# Altium project ika_kart.PrjPcb
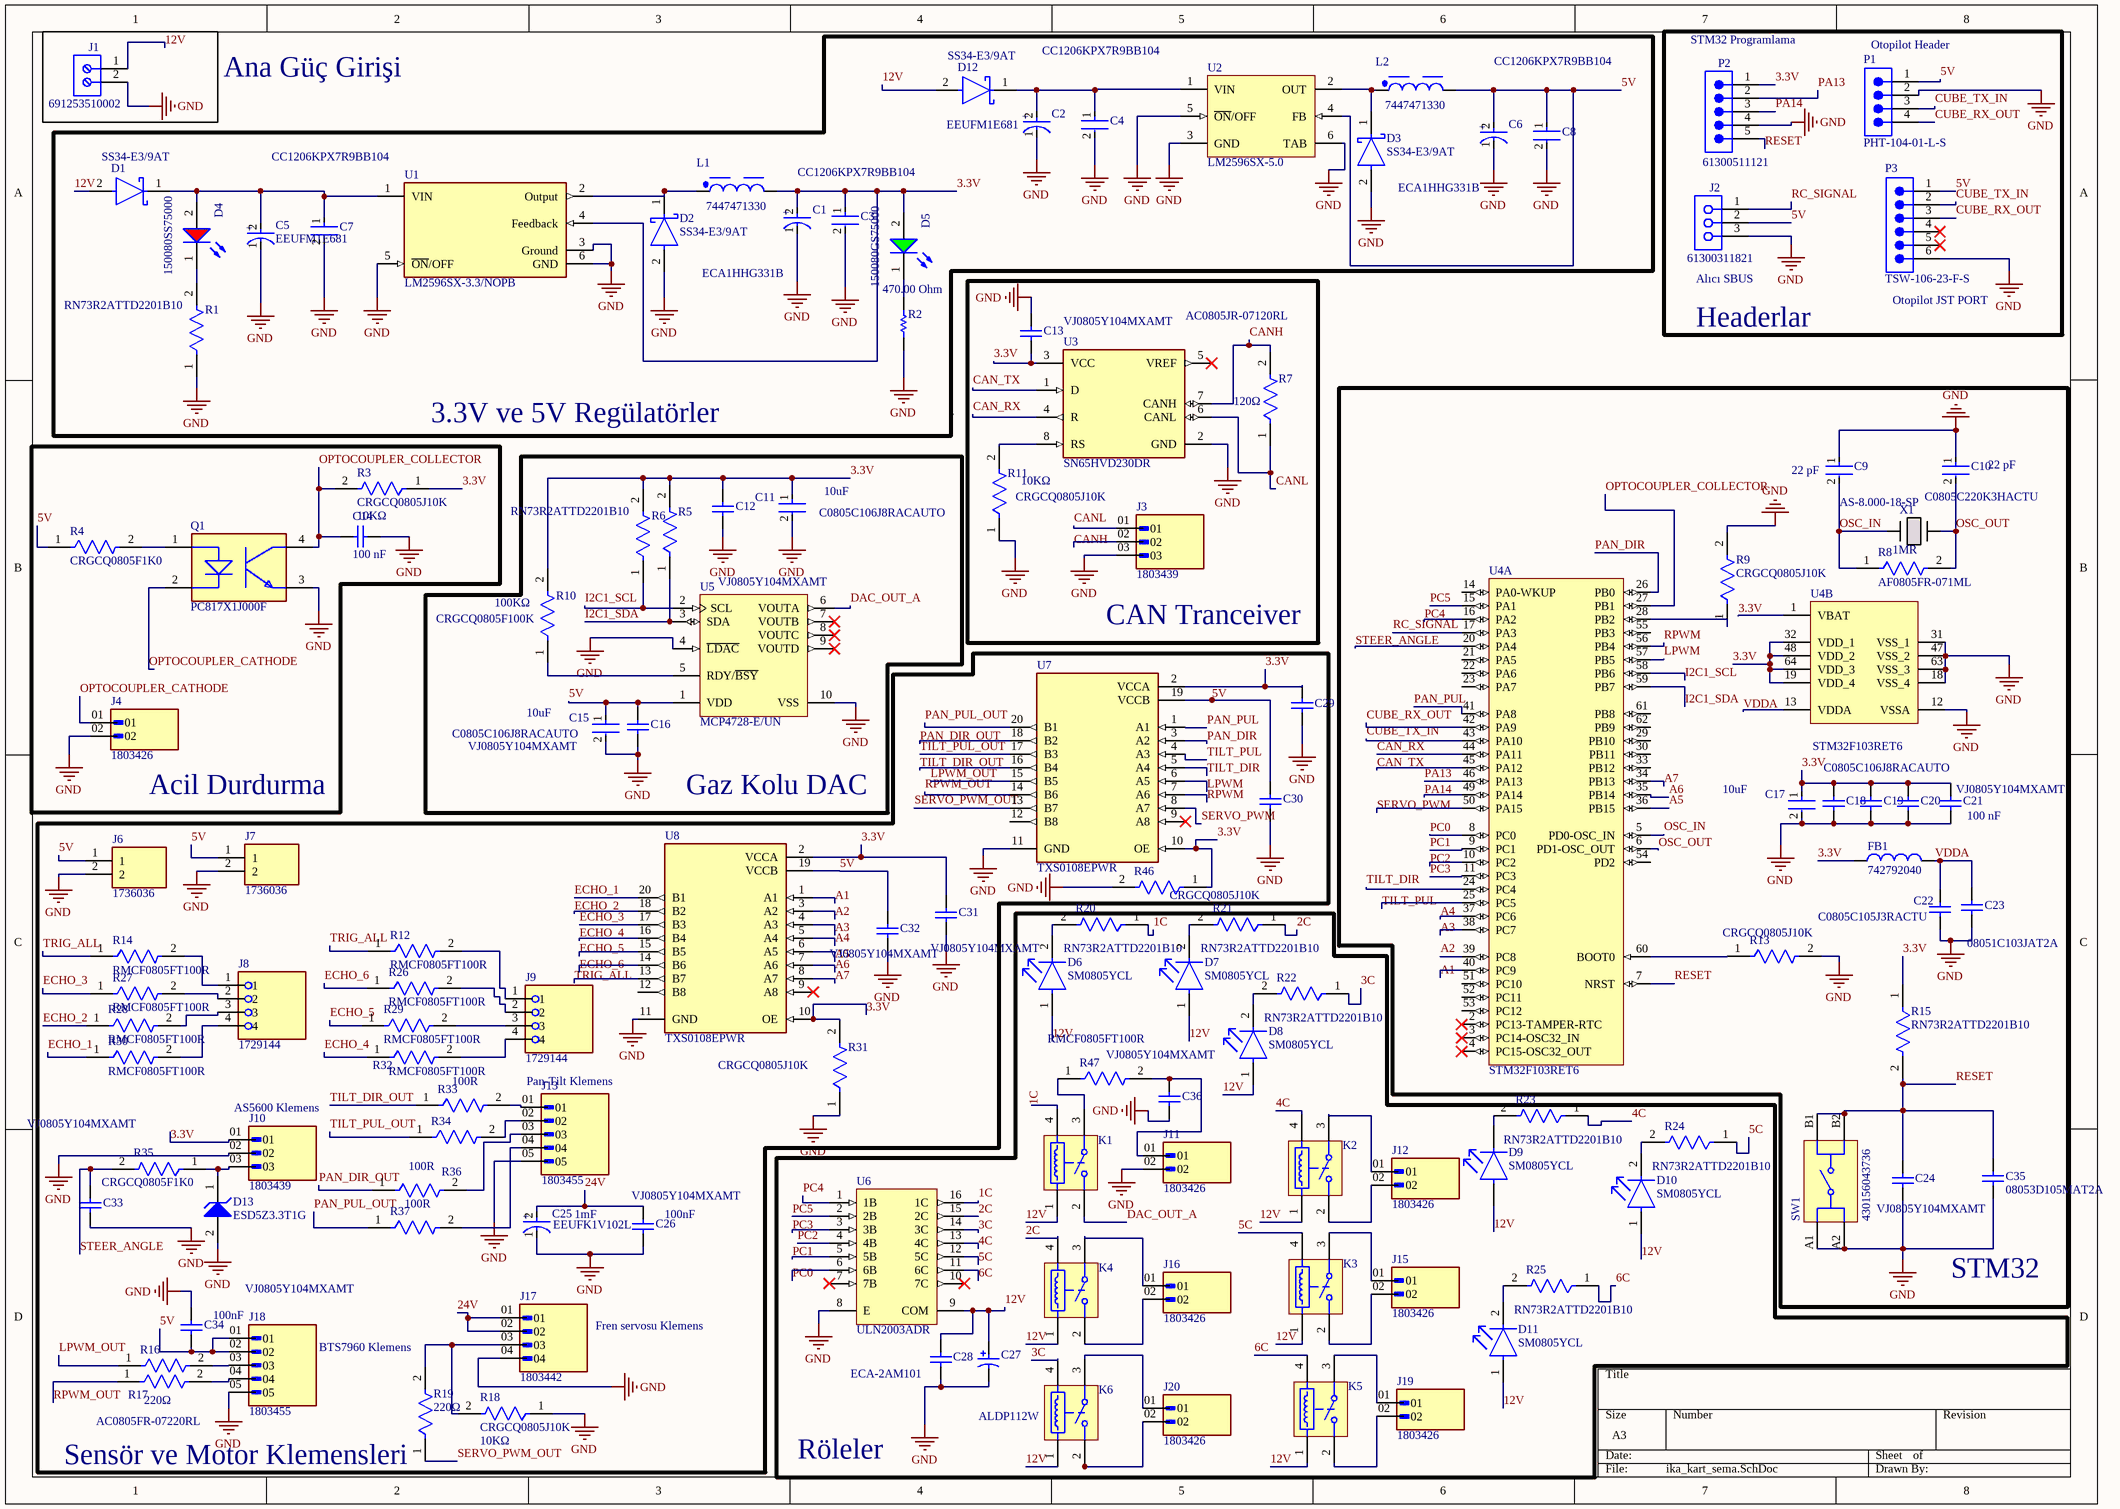
[diagram p0: ika_kart_sema.SchDoc]
1 sheet, 129 parts. Net scope: global (net labels, ports and power ports of the same name join across sheets).
Board file: ika_pcb.PcbDoc

## Sheet ika_kart_sema.SchDoc
size A3; SheetNumber: 1; SheetTotal: 1

### Parts
C1  ECA1HHG331B  [FP-RAD-TH-D_10_0_5-L_16_1-MFG]
C2  EEUFM1E681  [FP-RAD-TH-D_10_0_5-L_20_2-MFG]
C3  CC1206KPX7R9BB104  [FP-CC1206-1_25-MFG]
C4  CC1206KPX7R9BB104  [FP-CC1206-1_25-MFG]
C5  EEUFM1E681  [FP-RAD-TH-D_10_0_5-L_20_2-MFG]
C6  ECA1HHG331B  [FP-RAD-TH-D_10_0_5-L_16_1-MFG]
C7  CC1206KPX7R9BB104  [FP-CC1206-1_25-MFG]
C8  CC1206KPX7R9BB104  [FP-CC1206-1_25-MFG]
C9  value 22 pF  [FP-C0805C-DN-MFG]  (hidden comment: C0805C220K3HACTU)
C10  C0805C220K3HACTU  Capacitance: 22 pF  [FP-C0805C-DN-MFG]
C11  C0805C106J8RACAUTO  Capacitance: 10uF  [FP-C0805C106J8RACAUTO-MFG]
C12  VJ0805Y104MXAMT  [CAPC2013X145X48LL20T23]
C13  VJ0805Y104MXAMT  [CAPC2013X145X48LL20T23]
C14  100 nF  [CAPC2013X145X48LL20T23]
C15  C0805C106J8RACAUTO  Capacitance: 10uF  [FP-C0805C106J8RACAUTO-MFG]
C16  VJ0805Y104MXAMT  [CAPC2013X145X48LL20T23]
C17  C0805C106J8RACAUTO  Capacitance: 10uF  [FP-C0805C106J8RACAUTO-MFG]
C18  VJ0805Y104MXAMT  [CAPC2013X145X48LL20T23]
C19  100 nF  [CAPC2013X145X48LL20T23]
C20  VJ0805Y104MXAMT  [CAPC2013X145X48LL20T23]  (value not drawn)
C21  VJ0805Y104MXAMT  [CAPC2013X145X48LL20T23]  (value not drawn)
C22  C0805C105J3RACTU  [CAPC2013X145X50NL20T25]
C23  08051C103JAT2A  [CAPC2013X94X50LL20T25]
C24  VJ0805Y104MXAMT  [CAPC2013X145X48LL20T23]
C25  EEUFK1V102L  Capacitance: 1mF  [FP-RAD-TH-D_10_0_5-L_30_2-MFG]
C26  100nF  Part Number: VJ0805Y104MXAMT  [CAPC2013X145X48LL20T23]
C27  ECA-2AM101  [CAPPR65-500-1600X1000X1700]
C28  VJ0805Y104MXAMT  [CAPC2013X145X48LL20T23]  (value not drawn)
C29  VJ0805Y104MXAMT  [CAPC2013X145X48LL20T23]  (value not drawn)
C30  VJ0805Y104MXAMT  [CAPC2013X145X48LL20T23]  (value not drawn)
C31  VJ0805Y104MXAMT  [CAPC2013X145X48LL20T23]
C32  VJ0805Y104MXAMT  [CAPC2013X145X48LL20T23]
C33  VJ0805Y104MXAMT  [CAPC2013X145X48LL20T23]
C34  100nF  Part Number: VJ0805Y104MXAMT  [CAPC2013X145X48LL20T23]
C35  08053D105MAT2A  [CAPC2013X140X50LL20T25]
C36  VJ0805Y104MXAMT  [CAPC2013X145X48LL20T23]
D1  SS34-E3/9AT  [FP-SMC-MFG]
D2  SS34-E3/9AT  [FP-SMC-MFG]
D3  SS34-E3/9AT  [FP-SMC-MFG]
D4  150080SS75000  [WL-SMCW_0805_150080xx75000]
D5  150080GS75000  [WL-SMCW_0805_150080xx75000]
D6  SM0805YCL  [FP-SM0805YCL-MFG]
D7  SM0805YCL  [FP-SM0805YCL-MFG]
D8  SM0805YCL  [FP-SM0805YCL-MFG]
D9  SM0805YCL  [FP-SM0805YCL-MFG]
D10  SM0805YCL  [FP-SM0805YCL-MFG]
D11  SM0805YCL  [FP-SM0805YCL-MFG]
D12  SS34-E3/9AT  [FP-SMC-MFG]
D13  ESD5Z3.3T1G  [ONSC-SOD-523-2-502-01_V]
FB1  742792040  [WE-CBF_0805_L2W1.2H0.9_HC]
J1  691253510002  [691253510002]
J2  61300311821  [61300311821]
J3  1803439  [PHOENIX_1803439]
J4  1803426  [PHOENIX_1803426]
J6  1736036  [PHOENIX_1736036]
J7  1736036  [PHOENIX_1736036]
J8  1729144  [PHOENIX_1729144]
J9  1729144  [PHOENIX_1729144]
J10  1803439  [PHOENIX_1803439]
J11  1803426  [PHOENIX_1803426]
J12  1803426  [PHOENIX_1803426]
J13  1803455  [PHOENIX_1803455]
J15  1803426  [PHOENIX_1803426]
J16  1803426  [PHOENIX_1803426]
J17  1803442  [PHOENIX_1803442]
J18  1803455  [PHOENIX_1803455]
J19  1803426  [PHOENIX_1803426]
J20  1803426  [PHOENIX_1803426]
K1  ALDP112W  [PNSC-LD-P-4-2050x720x1530_V]  (value not drawn)
K2  ALDP112W  [PNSC-LD-P-4-2050x720x1530_V]  (value not drawn)
K3  ALDP112W  [PNSC-LD-P-4-2050x720x1530_V]  (value not drawn)
K4  ALDP112W  [PNSC-LD-P-4-2050x720x1530_V]  (value not drawn)
K5  ALDP112W  [PNSC-LD-P-4-2050x720x1530_V]  (value not drawn)
K6  ALDP112W  [PNSC-LD-P-4-2050x720x1530_V]
L1  7447471330  [WE-TIS_1111]
L2  7447471330  [WE-TIS_1111]
P1  PHT-104-01-L-S  [SMTC-PHT-104-01-X-S]
P2  61300511121  [61300511121]
P3  TSW-106-23-F-S  [SMTC-TSW-106-23-X-S]
Q1  PC817X1J000F  [FP-PC817X1J000F-MFG]
R1  RN73R2ATTD2201B10  [FP-RN73R2A-IPC_B]
R2  value 470.00 Ohm  [RESC0805(2012)_M]  (hidden comment: 470R 5% 0805(2012))
R3  CRGCQ0805J10K  Resistance: 10KΩ  [FP-CRGCQ0805-IPC_C]
R4  CRGCQ0805F1K0  [FP-CRGCQ0805-IPC_C]
R5  RN73R2ATTD2201B10  [FP-RN73R2A-IPC_B]  (value not drawn)
R6  RN73R2ATTD2201B10  [FP-RN73R2A-IPC_B]
R7  AC0805JR-07120RL  value 120Ω  [FP-AC0805-MFG]
R8  AF0805FR-071ML  Resistance: 1MR  [FP-AF0805-MFG]
R9  CRGCQ0805J10K  [FP-CRGCQ0805-IPC_C]
R10  CRGCQ0805F100K  Resistance: 100KΩ  [FP-CRGCQ0805-IPC_C]
R11  CRGCQ0805J10K  Resistance: 10KΩ  [FP-CRGCQ0805-IPC_C]
R12  RMCF0805FT100R  [FP-RMCF0805-IPC_A]
R13  CRGCQ0805J10K  [FP-CRGCQ0805-IPC_C]
R14  RMCF0805FT100R  [FP-RMCF0805-IPC_A]
R15  RN73R2ATTD2201B10  [FP-RN73R2A-IPC_B]
R16  AC0805FR-07220RL  [FP-AC0805-MFG]
R17  value 220Ω  [FP-AC0805-MFG]  (hidden comment: AC0805FR-07220RL)
R18  CRGCQ0805J10K  Resistance: 10KΩ  [FP-CRGCQ0805-IPC_C]
R19  value 220Ω  [FP-AC0805-MFG]  (hidden comment: AC0805FR-07220RL)
R20  RN73R2ATTD2201B10  [FP-RN73R2A-IPC_B]
R21  RN73R2ATTD2201B10  [FP-RN73R2A-IPC_B]
R22  RN73R2ATTD2201B10  [FP-RN73R2A-IPC_B]
R23  RN73R2ATTD2201B10  [FP-RN73R2A-IPC_B]
R24  RN73R2ATTD2201B10  [FP-RN73R2A-IPC_B]
R25  RN73R2ATTD2201B10  [FP-RN73R2A-IPC_B]
R26  RMCF0805FT100R  [FP-RMCF0805-IPC_A]
R27  RMCF0805FT100R  [FP-RMCF0805-IPC_A]
R28  RMCF0805FT100R  [FP-RMCF0805-IPC_A]
R29  RMCF0805FT100R  [FP-RMCF0805-IPC_A]
R30  RMCF0805FT100R  [FP-RMCF0805-IPC_A]
R31  CRGCQ0805J10K  [FP-CRGCQ0805-IPC_C]
R32  RMCF0805FT100R  [FP-RMCF0805-IPC_A]
R33  Resistance: 100R  [FP-RMCF0805-IPC_A]  (hidden comment: RMCF0805FT100R)
R34  RMCF0805FT100R  [FP-RMCF0805-IPC_A]  (value not drawn)
R35  CRGCQ0805F1K0  [FP-CRGCQ0805-IPC_C]
R36  Resistance: 100R  [FP-RMCF0805-IPC_A]  (hidden comment: RMCF0805FT100R)
R37  Resistance: 100R  [FP-RMCF0805-IPC_A]  (hidden comment: RMCF0805FT100R)
R46  CRGCQ0805J10K  [FP-CRGCQ0805-IPC_C]
R47  RMCF0805FT100R  [FP-RMCF0805-IPC_A]
SW1  430156043736  [430156043736]
U1  LM2596SX-3.3/NOPB  [FP-KTT0005B-MFG]
U2  LM2596SX-5.0  [TS5B_M]
U3  SN65HVD230DR  [FP-D0008A-IPC_A]
U4  STM32F103RET6  [STM-LQFP64_N]  (parts A,B of 2)
U5  MCP4728-E/UN  [MSOP-UN10_N]
U6  ULN2003ADR  [D0016A_M]
U7  TXS0108EPWR  [FP-PW0020A-IPC_C]
U8  TXS0108EPWR  [FP-PW0020A-IPC_C]
X1  AS-8.000-18-SP  [XTAL_AS_SP_RAL]

### Blocks framed on the sheet
3.3V ve 5V Regülatörler: C1-C8 D1-D5 D12 L1 L2 R1 R2 U1 U2
Headerlar: J2 P1-P3
CAN Tranceiver: C13 J3 R7 R11 U3
STM32: C9 C10 C17-C24 C35 FB1 R8 R9 R13 R15 SW1 U4 X1
Gaz Kolu DAC: C11 C12 C15 C16 R5 R6 R10 U5
Sensör ve Motor Klemensleri: C25 C26 C29-C34 D13 J6-J10 J13 J17 J18 R12 R14 R16-R19 R26-R37 R46 U7 U8
Röleler: C27 C28 C36 D6-D11 J11 J12 J15 J16 J19 J20 K1-K6 R20-R25 R47 U6

### Nets
GND: C1.1(C) C2.1(C) C3.2 C4.2 C5.1(C) C6.1(C) C7.2 C8.2 C9.1 C10.1 C11.2 C12.1 C13.2 C14.1 C15.2 C16.1 C17.2 C18.1 C19.1 C20.1 C21.1 C22.1 C23.1 C24.1 C25.1(C) C26.1 C27.2 C28.1 C29.1 C30.1 C31.1 C32.1 C33.1 C34.2 C35.1 C36.1 D2.2(A) D3.2(A) D13.2(A) J1.2 J2.3 J3.03 J4.02 J6.2 J7.2 J10.02 J11.02 J13.05 J17.04 J18.05 P1.2 P2.4 P3.6 Q1.3(E) R1.1 R2.1 R9.2 R11.1 R13.2 R18.1 R31.1 R46.2 SW1.A1 SW1.A2 U1.3(Ground) U1.5(~{ON}/OFF) U1.6(GND) U2.3(GND) U2.5(~{ON}/OFF) U2.6(TAB) U3.2(GND) U4.12(VSSA) U4.18(VSS_4) U4.31(VSS_1) U4.47(VSS_2) U4.63(VSS_3) U5.4(~{LDAC}) U5.10(VSS) U6.8(E) U7.11(GND) U8.11(GND)
1C: K1.4 R20.1 U6.16(1C)
2C: K4.4 R21.1 U6.15(2C)
3.3V: C1.2(A) C3.1 C11.1 C12.2 C13.1 C17.1 C18.2 C19.2 C20.2 C21.2 C29.2 C31.2 D5.2(A) FB1.1 J10.01 L1.2 P2.1 R3.1 R5.2 R6.2 R10.2 R15.1 R31.2 R46.1 U1.4(Feedback) U3.3(VCC) U4.1(VBAT) U4.19(VDD_4) U4.32(VDD_1) U4.48(VDD_2) U4.64(VDD_3) U7.2(VCCA) U7.10(OE) U8.2(VCCA) U8.10(OE)
3C: K6.4 R22.1 U6.14(3C)
4C: K2.4 R23.1 U6.13(4C)
5C: K3.4 R24.1 U6.12(5C)
5V: C6.2(A) C8.1 C15.1 C16.2 C30.2 C32.2 C34.1 J2.2 J6.1 J7.1 J18.01 J18.02 L2.2 P1.1 P3.1 R4.1 U2.4(FB) U5.1(VDD) U7.19(VCCB) U8.19(VCCB)
6C: K5.4 R25.1 U6.11(6C)
12V: C27.1 C28.2 D1.2(A) D6.1(A) D7.1(A) D8.1(A) D9.1(A) D10.1(A) D11.1(A) D12.2(A) J1.1 K1.1 K2.1 K3.1 K4.1 K5.1 K6.1 U6.9(COM)
24V: C25.2(A) C26.2 J17.01 J17.02
A1: U4.40(PC9) U8.1(A1)
A2: U4.39(PC8) U8.3(A2)
A3: U4.38(PC7) U8.4(A3)
A4: U4.37(PC6) U8.5(A4)
A5: U4.36(PB15) U8.6(A5)
A6: U4.35(PB14) U8.7(A6)
A7: U4.34(PB13) U8.8(A7)
CAN_RX: U3.4(R) U4.44(PA11)
CAN_TX: U3.1(D) U4.45(PA12)
CANH: J3.02 R7.2 U3.7(CANH)
CANL: J3.01 R7.1 U3.6(CANL)
CUBE_RX_OUT: P1.4 P3.3 U4.42(PA9)
CUBE_TX_IN: P1.3 P3.2 U4.43(PA10)
DAC_OUT_A: K1.2(NO) U5.6(VOUTA)
ECHO_1: R30.1 U8.20(B1)
ECHO_2: R28.1 U8.18(B2)
ECHO_3: R27.1 U8.17(B3)
ECHO_4: R32.1 U8.16(B4)
ECHO_5: R29.1 U8.15(B5)
ECHO_6: R26.1 U8.14(B6)
I2C1_SCL: R6.1 U4.58(PB6) U5.2(SCL)
I2C1_SDA: R5.1 U4.59(PB7) U5.3(SDA)
LPWM: U4.57(PB5) U7.6(A5)
LPWM_OUT: R16.1 U7.15(B5)
OPTOCOUPLER_CATHODE: J4.01 Q1.2(C)
OPTOCOUPLER_COLLECTOR: C14.2 Q1.4(C) R3.2 U4.27(PB1)
OSC_IN: C9.2 R8.1 U4.5(PD0-OSC_IN) X1.1
OSC_OUT: C10.2 R8.2 U4.6(PD1-OSC_OUT) X1.2
PA13: P2.2 U4.46(PA13)
PA14: P2.3 U4.49(PA14)
PAN_DIR: U4.26(PB0) U7.3(A2)
PAN_DIR_OUT: R36.1 U7.18(B2)
PAN_PUL: U4.41(PA8) U7.1(A1)
PAN_PUL_OUT: R37.1 U7.20(B1)
PC0: U4.8(PC0) U6.6(6B)
PC1: U4.9(PC1) U6.5(5B)
PC2: U4.10(PC2) U6.4(4B)
PC3: U4.11(PC3) U6.3(3B)
PC4: U4.16(PA2) U6.1(1B)
PC5: U4.15(PA1) U6.2(2B)
RC_SIGNAL: J2.1 U4.17(PA3)
RESET: C24.2 C35.2 P2.5 R15.2 SW1.B1 SW1.B2 U4.7(NRST)
RPWM: U4.56(PB4) U7.7(A6)
RPWM_OUT: R17.1 U7.14(B6)
SERVO_PWM: U4.50(PA15) U7.8(A7)
SERVO_PWM_OUT: R19.1 U7.13(B7)
STEER_ANGLE: C33.2 R35.2 U4.20(PA4)
TILT_DIR: U4.24(PC4) U7.5(A4)
TILT_DIR_OUT: R33.1 U7.16(B4)
TILT_PUL: U4.25(PC5) U7.4(A3)
TILT_PUL_OUT: R34.1 U7.17(B3)
TRIG_ALL: R12.1 R14.1 U8.13(B7)
VDDA: C22.2 C23.2 FB1.2 U4.13(VDDA)
NetC2_2: C2.2(A) C4.1 D12.1(C) U2.1(VIN)
NetC5_2: C5.2(A) C7.1 D1.1(C) D4.2(A) U1.1(VIN)
NetC36_2: C36.2 J11.01 R47.2
NetD2_1: D2.1(C) L1.1 U1.2(Output)
NetD3_1: D3.1(C) L2.1 U2.2(OUT)
NetD4_1: D4.1(K) R1.2
NetD5_1: D5.1(K) R2.2
NetD6_2: D6.2(C) R20.2
NetD7_2: D7.2(C) R21.2
NetD8_2: D8.2(C) R22.2
NetD9_2: D9.2(C) R23.2
NetD10_2: D10.2(C) R24.2
NetD11_2: D11.2(C) R25.2
NetD13_1: D13.1(K) J10.03 R35.1
NetJ8_1: J8.1 R14.2
NetJ8_2: J8.2 R27.2
NetJ8_3: J8.3 R28.2
NetJ8_4: J8.4 R30.2
NetJ9_1: J9.1 R12.2
NetJ9_2: J9.2 R26.2
NetJ9_3: J9.3 R29.2
NetJ9_4: J9.4 R32.2
NetJ12_01: J12.01 K2.3(COM)
NetJ12_02: J12.02 K2.2(NO)
NetJ13_01: J13.01 R33.2
NetJ13_02: J13.02 R34.2
NetJ13_03: J13.03 R36.2
NetJ13_04: J13.04 R37.2
NetJ15_01: J15.01 K3.3(COM)
NetJ15_02: J15.02 K3.2(NO)
NetJ16_01: J16.01 K4.3(COM)
NetJ16_02: J16.02 K4.2(NO)
NetJ17_03: J17.03 R18.2 R19.2
NetJ18_03: J18.03 R16.2
NetJ18_04: J18.04 R17.2
NetJ19_01: J19.01 K5.3(COM)
NetJ19_02: J19.02 K5.2(NO)
NetJ20_01: J20.01 K6.3(COM)
NetJ20_02: J20.02 K6.2(NO)
NetK1_3: K1.3(COM) R47.1
NetQ1_1: Q1.1(A) R4.2
NetR9_1: R9.1 U4.28(PB2)
NetR10_1: R10.1 U5.5(RDY/~{BSY})
NetR11_2: R11.2 U3.8(RS)
NetR13_1: R13.1 U4.60(BOOT0)

Not connected (* = marked no-connect by the designer): P3 4* 5*; U3 5(VREF)*; U4 2(PC13-TAMPER-RTC)* 3(PC14-OSC32_IN)* 4(PC15-OSC32_OUT)* 14(PA0-WKUP) 21(PA5) 22(PA6) 23(PA7) 29(PB10) 30(PB11) 33(PB12) 51(PC10) 52(PC11) 53(PC12) 54(PD2) 55(PB3) 61(PB8) 62(PB9); U5 7(VOUTB)* 8(VOUTC)* 9(VOUTD)*; U6 7(7B)* 10(7C)*; U7 9(A8)* 12(B8); U8 9(A8)* 12(B8)

### Notes on the sheet
- (near P2) STM32 Programlama
- Ana Güç Girişi
- (near P1) Otopilot Header
- (near J2) Alıcı SBUS
- (near P3) Otopilot JST PORT
- Acil Durdurma
- (near J10) AS5600 Klemens
- (near J13) Pan-Tilt Klemens
- Fren servosu Klemens
- BTS7960 Klemens
- (in symbol CMP-05427-000698-1) +
- (in symbol CMP-05427-000707-1) +
- (in symbol CMP-05427-000865-1) +

### Library data of the parts
C1 C6 = CMP-05427-000698-1: Aluminum Electrolytic Capacitors (Radial Lead Type) AEC-Q200 Qualified 330uF ±20% 50V; Life (Hours): 2000Hour; Ripple Current: 410mA; Lead Diameter: 0.6mm; Lead/Base Style: Straight; Diameter: 10mm; Termination: Radial; Length: 16mm; Construction: RADIAL; Lead Pitch: 5mm; Mount: Through Hole; Max Operating Temperature: 105°C; Package Quantity: 500; Packaging: Ammo Pack; Voltage Rating (DC): 50V; Contact Plating: Tin; Min Operating Temperature: -55°C; Capacitance: 330uF; Height: 16mm; Series: NHG; Tolerance: 20%; RoHS Compliant: Yes; Case/Package: Radial; Radiation Hardening: No
C2 C5 = CMP-05427-000865-1: Aluminum Electrolytic Capacitors (Radial Lead Type) 680uF ±20% 25V; Dissipation Factor: 0.14%; Lead Diameter: 0.6mm; Ripple Current: 2.18A; Polarity: Polar; Life (Hours): 5000Hour; Impedance: 19mR; Dielectric Material: Aluminium; Radiation Hardening: No; Voltage: 25V; Lead Pitch: 5mm; Package Quantity: 200; Height: 20mm; Diameter: 10mm; Lead Free: Lead Free; RoHS Compliant: Yes; Min Operating Temperature: -40°C; REACH SVHC: No SVHC; Construction: RADIAL; Height - Seated (Max): 0.866inch; Packaging: Bulk; Voltage Rating: 25V; Case/Package: Radial; Voltage Rating (DC): 25V; Tolerance: 20%; Capacitance: 680uF; Max Operating Temperature: 105°C; Length: 20mm; Series: FM; Mount: Through Hole; Termination: Radial; ESR (Equivalent Series Resistance): 19mR
C3 C4 C7 C8 = CMP-03422-000130-1: CC1206 100 nF X7R 10.00%50 V; Manufacturer: Yageo; Capacitance: 100 nF; Tolerance: 0.1; Value: 100 nF; Temperature Coefficient: 15%; Material: Ceramic; Voltage Rating: 50 V; Automotive Grade: NA; Octopart: https://octopart.com/cc1206kpx7r9bb104-yageo-16251820; Footprint Url: http://www.yageo.com/exep/pages/download/literatures/UPY-C_GEN_24.pdf; ComponentLink2Description: Datasheet; Temperature Range Low: -55°C; Temperature: -55°C to +125°C; RoHS: TRUE; Mouser Description: Surface Mount Ceramic Multilayer Capacitor 0.1uF 10% X7R 50V 1206 Paper T/R; Device Class L1: Passive Components; Height: 1.45mm; Device Class L3: Ceramic Capacitors; Manufacturer Part Number: CC1206KPX7R9BB104; Temperature Characteristic: X7R; Device Class L2: Capacitors; Package: CC1206-1.25; Category: Cap; Lead Free: Yes; Automotive: No; ComponentLink2URL: http://www.yageo.com/documents/recent/UPY-NP0X7R_HV_1KV-to-3KV_11.pdf; Temperature Range High: +125°C
C9 = CMP-03020-002873-1: C0805 22 pF X8R 30ppm/°C 10.00% 25 V; Manufacturer: KEMET; Tolerance: 0.1; Material: Ceramic; Voltage Rating: 25 V; Temperature Characteristic: X8R; Automotive: No; Temperature Coefficient: 30ppm/°C; Category: Cap; Capacitance: 22 pF; Device Class L1: Passive Components; Octopart: https://octopart.com/c0805c220k3hactu-kemet-88697045; Manufacturer Part Number: C0805C220K3HACTU; Package: C0805C-DN; Device Class L3: Ceramic Capacitors; ComponentLink2URL: https://content.kemet.com/datasheets/KEM_C1003_C0G_SMD.pdf; Lead Free: Yes; Device Class L2: Capacitors; Temperature: -55°C to +125°C; Temperature Range High: +125°C; Temperature Range Low: -55°C; RoHS: TRUE; Height: 0.88mm; Ipc Land Pattern Name: CAPC200125X78; ComponentLink2Description: Datasheet
C10 = CMP-03020-002873-1: C0805 22 pF X8R 30ppm/°C 10.00% 25 V; Manufacturer: KEMET; Tolerance: 0.1; Value: 22 pF; Material: Ceramic; Voltage Rating: 25 V; Temperature Characteristic: X8R; Automotive: No; Temperature Coefficient: 30ppm/°C; Category: Cap; Device Class L1: Passive Components; Octopart: https://octopart.com/c0805c220k3hactu-kemet-88697045; Manufacturer Part Number: C0805C220K3HACTU; Package: C0805C-DN; Device Class L3: Ceramic Capacitors; ComponentLink2URL: https://content.kemet.com/datasheets/KEM_C1003_C0G_SMD.pdf; Lead Free: Yes; Device Class L2: Capacitors; Temperature: -55°C to +125°C; Temperature Range High: +125°C; Temperature Range Low: -55°C; RoHS: TRUE; Height: 0.88mm; Ipc Land Pattern Name: CAPC200125X78; ComponentLink2Description: Datasheet
C11 C15 C17 = CMP-03020-034708-1: CAP CER 10UF 10V X7R 0805; Tolerance: 5%; Mount: Surface Mount; Voltage Rating: 10V; Max Operating Temperature: 125°C; Min Operating Temperature: -55°C; Case/Package: 0805; RoHS Compliant: Yes; Packaging: Tape and Reel; Case Code (Imperial): 0805; Case Code (Metric): 2012; Ratings: AEC-Q200
C12 C13 C16 C18 C20 C21 C24 C26 C28-C34 C36 = CMP-2007-01796-1: Manufacturer: Vitramon
  C12 C13 C16 C18 C20 C21 C24 C28-C33 C36: Part Number: VJ0805Y104MXAMT
C14 C19 = CMP-2007-01796-1: Part Number: VJ0805Y104MXAMT; Manufacturer: Vitramon
C22 = CMP-2007-01121-1: Manufacturer: Kemet; Part Number: C0805C105J3RACTU
C23 = CMP-2007-04163-1: Manufacturer: AVX Interconnect / Elco; Part Number: 08051C103JAT2A
C25 = CMP-05427-000707-1: Aluminum Electrolytic Capacitors (Radial Lead Type) AEC-Q200 Qualified 1000uF ±20% 35V; Lead/Base Style: Straight; Ripple Current: 2.14A; Lead Diameter: 0.6mm; Dissipation Factor: 0.12%; Life (Hours): 4000Hour; Dielectric Material: Aluminium; Tolerance: 20%; Height: 30mm; Max Operating Temperature: 105°C; Radiation Hardening: No; Voltage: 35V; Construction: RADIAL; Termination: Radial; Packaging: Bulk; Case/Package: Radial; Package Quantity: 100; Series: FK; Contact Plating: Tin; Voltage Rating (DC): 35V; Mount: Through Hole; RoHS Compliant: Yes; Diameter: 10mm; Lead Pitch: 5mm; REACH SVHC: No SVHC; Min Operating Temperature: -55°C; Voltage Rating: 35V; Length: 30mm
C27 = CMP-1665-00044-1: Aluminum Electrolytic Capacitor, 100 uF, +/- 20%, 100 V, -40 to 85 degC, 2-Pin THD, RoHS, Bulk; Power Rating: 250 mW; Tolerance: 1%; Resistance: 100 Ohm; Type (Resistor): Carbon Film; Voltage Rating: 250 V; Case\Package: Axial; RoHSCompliant: true; Max Operating Temperature: 155 degC; DatasheetVersion: Mar-16; PackageDescription: 2-Pin Through Hole Device, Dia 10 mm, Body Length 16 mm; ComponentLink1Description: Manufacturer URL; Package Quantity: 200; Mount: Through Hole; ComponentLink2URL: https://industrial.panasonic.com/cdbs/www-data/pdf/RDF0000/ABA0000C1047.pdf; Packaging: Bulk; Length: 0.248 inch; PackageReference: CAPPR65-500-1600X1000X1700; ComponentLink2Description: Datasheet; Min Operating Temperature: -55 degC; ComponentLink1URL: http://www.panasonic.com/
C35 = CMP-2007-04611-1: Manufacturer: AVX Interconnect / Elco; Part Number: 08053D105MAT2A
D1-D3 D12 = CMP-02539-000066-1: DIODE SCHOTTKY 40V 3A DO214AB; Peak Non-Repetitive Surge Current: 100A; Forward Voltage: 500mV; Element Configuration: Single; Max Reverse Current: 500uA; Case/Package: SMC; Radiation Hardening: No; Series: -; Max Surge Current: 100A; RoHS Compliant: Yes; Min Operating Temperature: -55°C; Average Rectified Current: 3A; Max Reverse Leakage Current: 500uA; Package Quantity: 3500; Max Reverse Voltage (DC): 40V; Forward Current: 3A; Packaging: Tape and Reel; Max Operating Temperature: 125°C; Max Repetitive Reverse Voltage (Vrrm): 40V; Number of Pins: 2; Mount: Surface Mount
D4 = CMP-1426-00010-5: WL-SMCW SMD chip LED top view monocolor waterclear; Manufacturer Lifecycle Status: ACTIVE; Manufacturer Package Identifier: 0805 (2012 metric); Reverse Voltage: 5V; Luminous Intensity: 60mcd; Forward Voltage: 1.9V; Wavelength: 630nm; Forward Current: 100mA; Max Junction Temperature (Tj): 95°C; Test Current: 20mA; Peak Wavelength: 645nm; Lens Style: Clear, Rectangular; Power Dissipation: 72mW; Viewing Angle: 140°; YEOL: 1 = Estimated lifetime > 10 years; Color: Red; Length: 2mm; Lifecycle Status: Production; Width: 1.25mm; RoHS: Compliant; Packaging: Tape and Reel; REACH SVHC: Unknown; Max Operating Temperature: 85°C; Dominant Wavelength: 630nm; Max Reverse Voltage (DC): 5V; Min Operating Temperature: -40°C; Mount: Surface Mount; Case/Package: 0805; Case Code (Metric): 2012; Height: 700µm; Case Code (Imperial): 0805
D5 = CMP-1426-00007-4: WURTH ELEKTRONIK - 150080GS75000 - LED, Green, SMD, 0805, 30 mA, 3.2 V, 520 nm; Manufacturer Lifecycle Status: ACTIVE; Manufacturer Package Identifier: 0805 (2012 metric); Test Current: 20mA; Forward Current: 100mA; Wavelength: 525nm; Max Junction Temperature (Tj): 95°C; Luminous Intensity: 450mcd; Reverse Voltage: 5V; Viewing Angle: 140°; Peak Wavelength: 515nm; Lens Style: Clear, Rectangular; Power Dissipation: 105mW; YEOL: 1 = Estimated lifetime > 10 years; Forward Voltage: 3.2V; Mount: Surface Mount; REACH SVHC: Unknown; Height: 700µm; Case Code (Metric): 2012; Case Code (Imperial): 0805; Dominant Wavelength: 525nm; RoHS: Compliant; Color: Green; Case/Package: 0805; Length: 2mm; Packaging: Tape and Reel; Max Reverse Voltage (DC): 5V; Min Operating Temperature: -40°C; Max Operating Temperature: 85°C; Width: 1.25mm; Lifecycle Status: Production
D6-D11 = CMP-35283-000007-1: LED YELLOW CLEAR 0805 SMD; Luminous Intensity: 11.5mcd; Test Current: 2mA; Viewing Angle: 130°; Dominant Wavelength: 592nm; Forward Voltage: 1.9V; Lens Color: Colorless; Case Code (Metric): 2012; Illumination Color: Yellow; Length: 2mm; Max Operating Temperature: 80°C; Width: 1.2mm; Case Code (Imperial): 0805; Packaging: Tape and Reel; Lens Transparency: Clear; Mount: Surface Mount; Case/Package: 0805; Forward Current: 2mA; Height: 0.8mm; Lead Free: Lead Free; Min Operating Temperature: -30°C; Color: Yellow; Package Quantity: 4000
D13 = CMP-1063-00098-1: Transient Voltage Suppressor, Micro-Packaged Diode for ESD Protection, 2-Pin SOD-523, Pb-Free, Tape and Reel; Manufacturer: On Semiconductor; VRWM Max (V): 3.3; Number of Lines: 1; V(BR) Min (V): 5; PPK Max (W): 158; Direction: Unidirectional; IR Max (uA): 0.05; PackageReference: SOD-523-2-502-01; PackageVersion: Rev. E, 09/2010; RoHS: Pb-Free; ComponentLink3Description: Package Specification; Packing: Tape and Reel; ComponentLink1URL: http://www.onsemi.com/; DatasheetVersion: Rev. 10; ComponentLink2Description: Datasheet; Mounting Technology: Surface Mount; ComponentLink2URL: http://www.onsemi.cn/pub_link/Collateral/ESD5Z2.5T1-D.PDF; PartNumber: ESD5Z3.3T1G; PackageDescription: 2-Pin SOD, Body 1.2 x 0.8 mm; ComponentLink3URL: http://www.onsemi.com/pub_link/Collateral/502-01.PDF; ComponentLink1Description: Manufacturer URL
FB1 = CMP-0220-00032-3: NexarPartId: 21041532; Series Resistance: 150mΩ; Current Rating: 2A; Impedance: 600Ω; Tolerance: 25%; Width: 1.2mm; Max Operating Temperature: 125°C; Packaging: Cut Tape (CT); Height: 900µm; RoHS: Compliant; Case/Package: 0805; Resistance: 150mΩ; Core Material: Ferrite; RMS Current (Irms): 2A; Length: 2mm; Min Operating Temperature: -55°C
J1 = CMP-1502-02670-3: Terminal Block, Wtb, 2Way, 30-12Awg Rohs Compliant: Yes; Number of Contacts: 2; Voltage Rating: 300V; Current Rating: 16A; Min Operating Temperature: -30°C; RoHS: Compliant; Number of Rows: 1; Max Operating Temperature: 120°C; Height: 18.1mm; Contact Material: Nickel, Tin
J2 = CMP-1502-01315-4: Btb Conn, Rcpt, 3Pos, 1Row, 2.54Mm Rohs Compliant: Yes; Current Rating: 3A; Operating Supply Voltage: 250V; Contact Resistance: 20mΩ; Gender: Female; Number of Pins: 3; Lead Pitch: 2.54mm; RoHS: Non-Compliant; Orientation: Vertical
J3 J10 = 1803439: MF: {'manufacturer': u'Phoenix Contact'}; Package: None; Price: None; Value: *; MP: 1803439; Availability: Unavailable
J4 J11 J12 J15 J16 J19 J20 = 1803426: Pluggable Header 3.81mm 16AWG 160V 8A 2 Position COMBICON MCV Series | Phoenix Contact 1803426; SnapEDA_Link: https://www.snapeda.com/parts/1803426/Phoenix+Contact/view-part/?ref=snap; Package: None; Value: *; MF: Phoenix Contact; MP: 1803426; Check_prices: https://www.snapeda.com/parts/1803426/Phoenix+Contact/view-part/?ref=eda
J6 J7 = 1736036: Connector;PCB header;12A;250V;2-position;MSTBA 2 5/ 2-G-5 08 VPE500 | Phoenix Contact 1736036; SnapEDA_Link: https://www.snapeda.com/parts/1736036/Phoenix+Contact/view-part/?ref=snap; Package: None; Value: *; MF: Phoenix Contact; MP: 1736036; Check_prices: https://www.snapeda.com/parts/1736036/Phoenix+Contact/view-part/?ref=eda
J8 J9 = 1729144: PCB Terminal Screw 5.08mm 16AWG 400V 13.5A 4 Position COMBICON MKDSN Series | Phoenix Contact 1729144; SnapEDA_Link: https://www.snapeda.com/parts/1729144/Phoenix+Contact/view-part/?ref=snap; Package: None; Value: *; MF: Phoenix Contact; MP: 1729144; Check_prices: https://www.snapeda.com/parts/1729144/Phoenix+Contact/view-part/?ref=eda
J13 J18 = 1803455: Pluggable Header 3.81mm 16AWG 160V 8A 5 Position COMBICON MCV Series | Phoenix Contact 1803455; SnapEDA_Link: https://www.snapeda.com/parts/1803455/Phoenix+Contact/view-part/?ref=snap; Package: None; Value: *; MF: Phoenix Contact; MP: 1803455; Check_prices: https://www.snapeda.com/parts/1803455/Phoenix+Contact/view-part/?ref=eda
K1-K6 = CMP-1503-00157-1: LD-P Relays, 12 V Coil Voltage, 200 mW Nominal Operating Power, -40 to 85 degC, 4-Pin LD-P, Carton, Case, RoHS; Manufacturer: Panasonic; Mechanical Life(Min.operation): 5x10^6; Pb-Free: True; Max Switching Voltage: 277 V AC, 30 V DC; Coil Voltage: 12 V; Nominal Operating Power: 200 mW; Electrical Life: 2x10^5; Max Switching Current: 5 A AC, 3 A DC; PartNumber: ALDP112W; DatasheetVersion: 201402-T; ComponentLink2URL: http://www3.panasonic.biz/ac/e_download/control/relay/power/catalog/mech_eng_ldp.pdf?f_cd=300242; ComponentLink2Description: Datasheet; ComponentLink3URL: http://www3.panasonic.biz/ac/e_download/control/relay/power/catalog/mech_eng_ldp.pdf?f_cd=300242; ComponentLink3Description: Package Specification; Mounting Technology: Through Hole; PackageDescription: 4-Pin Through Hole Terminal Package, Body 20.5 x 7.2 mm; Packing: Carton, Case; PackageVersion: ASCTB193E, 02/2014; ComponentLink1Description: Manufacturer URL; RoHS: True; Series: LD-P Relays; PackageReference: LD-P-4-2050x720x1530; ComponentLink1URL: http://www3.panasonic.biz/ac/ae/index.jsp
L1 L2 = CMP-1406-00003-3: Inductor Power Shielded Wirewound 33uH 20% 1KHz Ferrite 3.6A 61mOhm DCR RDL Tray; Self Resonant Frequency: 10MHz; Inductance: 33µH; Saturation Current: 2.8A; Current Rating: 3A; DC Resistance (DCR): 57mΩ; Series Resistance: 50mΩ; Lead Diameter: 650µm; Height: 11.5mm; Lead Pitch: 5mm; Features: Shielded; Min Operating Temperature: -40°C; Ambient Temperature Range Low: -40°C; Frequency: 10MHz; Ambient Temperature Range High: 85°C; RMS Current (Irms): 3.6A; Inductance Tolerance: 20%; Mount: Radial, Through Hole; Length: 11mm; Core Material: Ferrite; REACH SVHC: Unknown; Max Operating Temperature: 125°C; Max DC Current: 3.6A; Shielding: Shielded; Case/Package: Radial; Tolerance: 20%; Width: 11mm; Diameter: 11mm; Test Frequency: 1kHz; RoHS: Compliant; Number of Pins: 2
P1 = CMP-1024-00182-1: Press Fit Header, Through-hole, Vertical, -55 to 125 degC, 2.54 mm Pitch, 4-Pin, Male, RoHS; Manufacturer: Samtec; Pitch: 2.54 mm; PackageDescription: .100 Press Fit Socket Assembly; ComponentLink2URL: http://www.samtec.com/documents/webfiles/pdf/pht.pdf; ComponentLink3Description: Package Specification; Temperature Range: -55 to 125 degC; ComponentLink1URL: http://www.samtec.com; PartNumber: PHT-104-01-L-S; Orientation: Vertical; ComponentLink1Description: Manufacturer URL; RoHS: True; DatasheetVersion: F-214; Mounting Technology: Through-hole; PackageReference: PHT-104-01-X-S; ComponentLink2Description: Datasheet; ComponentLink3URL: http://www.samtec.com/documents/webfiles/cpdf/PHT-1XX-XX-X-X-XXX-MKT.pdf; PackageVersion: J, 9/2009
P2 = CMP-1502-01068-4: THT Vertical Pin Header WR-PHD, Pitch 2.54 mm, Single Row, 5 pins; Number of Contacts: 5; Connector Type: Male Pin; Operating Supply Voltage: 250V; Contact Resistance: 20mΩ; Gender: Male; Pitch: 2.54mm; Current Rating: 3A; Min Operating Temperature: -40°C; Contact Material: Gold; Color: Black; RoHS: Compliant; Number of Rows: 1; Lead Free: Lead Free; Height: 8.89mm; Contact Plating: Gold; Number of Pins: 5; Orientation: Vertical; Voltage Rating: 250V; Packaging: Bulk; Number of Positions: 5; Max Operating Temperature: 105°C; Termination: Solder; Lead Pitch: 2.54mm; Contact Mating Length: 5.9944mm; Mount: Through Hole
P3 = CMP-1024-00398-1: 0.025" SQ Post Header, Through-hole, Vertical, -55 to 125 degC, 2.54 mm Pitch, 6-Pin, Male, RoHS; Manufacturer: Samtec; Pitch: 2.54 mm; ComponentLink3Description: Package Specification; ComponentLink3URL: http://www.samtec.com/documents/webfiles/cpdf/TSW-XXX-XX-XXX-X-XX-XXX-MKT.pdf; Orientation: Vertical; ComponentLink1Description: Manufacturer URL; ComponentLink1URL: http://www.samtec.com; Mounting Technology: Through-hole; ComponentLink2URL: http://www.samtec.com/documents/webfiles/pdf/TSW_TH.PDF; PackageDescription: .025[0.64] SQ. Post Terminal Strip Assembly; PartNumber: TSW-106-23-F-S; DatasheetVersion: F-214; PackageVersion: DM, 8/1988; Temperature Range: -55 to 125 degC; ComponentLink2Description: Datasheet; RoHS: True; PackageReference: TSW-106-23-X-S
Q1 = CMP-65434-000003-1: OPTOISOLATOR 5KV TRANS 4DIP; Collector Emitter Saturation Voltage: 200mV; Forward Voltage: 1.4V; Power Dissipation: 200mW; Input Current: 20mA; Max Collector Current: 50mA; Collector Emitter Breakdown Voltage: 80V; Rise Time: 18000ns; Number of Elements: 1; Reverse Breakdown Voltage: 6V; Current Transfer Ratio: 600%; Min Operating Temperature: -30°C; Number of Pins: 4; Radiation Hardening: No; Output Current per Channel: 50mA; Case/Package: DIP; Fall Time: 18000ns; Forward Current: 50mA; Isolation Voltage: 5kV; Package Quantity: 2000; Max Operating Temperature: 100°C; Packaging: Sleeve; Max Input Current: 50mA; Output Voltage: 80V; Max Power Dissipation: 200mW; Mount: Through Hole; Number of Channels: 1; Collector Emitter Voltage (VCEO): 80V
R1 R5 R6 R15 R20-R25 = CMP-04015-036100-1: 2.2kΩ ±0.1% 0.125W, 1/8W Chip Resistor 0805 (2012 Metric) Moisture Resistant Thin Film
R2 = CMP-1013-00066-1: 470R 0.125W 5% 0805 (2012 Metric)  SMD; Case-Metric: 2012; Case-EIA: 0805; Technology: SMT; Power: 0.125 W; Tolerance: 5 %
R3 R11 R18 = CMP-03211-002989-1: CRGCQ 0805 10K 5%; Manufacturer: TE Connectivity; Voltage Rating: 150V; Temperature Coefficient: ±100ppm/°C; Value: 10KΩ; Power Rating: 0.125W; Tolerance: 0.05; Automotive Grade: Grade 914; Height: 0.65mm; Lead Free: Yes; Temperature Range High: +155°C; Composition: Thick Film; Temperature Range Low: -55°C; Ambient Temperature Range High: +70°C; Temperature: -55°C to +155°C; Package: CRGCQ0805; Device Class L2: Resistors; RoHS: TRUE; ComponentLink2URL: https://www.te.com/commerce/DocumentDelivery/DDEController?Action=showdoc&DocId=Data+Sheet%7F1773204-3%7F1%7Fpdf%7FEnglish%7FENG_DS_1773204-3_1.pdf%7F4-2176341-923; Manufacturer Part Number: CRGCQ0805J10K; Series: CRGCQ; Device Class L1: Passive Components; Ipc Land Pattern Name: RESC200125X55; ComponentLink2Description: Datasheet; Category: Res; Digikey Description: CRGCQ 0805 10K 5%; Mouser Description: Res Thick Film 0805 10K Ohm 5% 0.125W(1/8W) ±100ppm/C Pad SMD Automotive T/R; Automotive: Yes; Octopart: https://octopart.com/crgcq0805j10k-te+connectivity-91018201; Device Class L3: Chip SMD Resistors
R4 R35 = CMP-03211-004613-1: CRGCQ 0805 1K0 1%; Manufacturer: TE Connectivity; Value: 1KΩ; Power Rating: 0.125W; Temperature Coefficient: ±100ppm/°C; Tolerance: 0.01; Automotive Grade: Grade 685; Voltage Rating: 150V; Digikey Description: CRGCQ 0805 1K0 1%; Octopart: https://octopart.com/crgcq0805f1k0-te+connectivity-91018154; ComponentLink2Description: Datasheet; Ipc Land Pattern Name: RESC200125X55; Device Class L2: Resistors; Device Class L1: Passive Components; Category: Res; Device Class L3: Chip SMD Resistors; Temperature Range Low: -55°C; Temperature Range High: +155°C; Automotive: Yes; Height: 0.65mm; Resistance: 1KΩ; ComponentLink2URL: https://www.te.com/commerce/DocumentDelivery/DDEController?Action=showdoc&DocId=Data+Sheet%7F1773204-3%7F1%7Fpdf%7FEnglish%7FENG_DS_1773204-3_1.pdf%7F4-2176341-694; Manufacturer Part Number: CRGCQ0805F1K0; Series: CRGCQ; Temperature: -55°C to +155°C; Composition: Thick Film; Lead Free: Yes; RoHS: TRUE; Ambient Temperature Range High: +70°C; Package: CRGCQ0805
R7 = CMP-03412-037390-1: RES SMD 120 OHM 5% 1/8W 0805; Manufacturer: Yageo; Tolerance: 0.05; Automotive Grade: Grade 0; Voltage Rating: 150V; Ipc Land Pattern Name: RESC200125X50; Category: Res; RoHS: TRUE; Package: AC0805; Temperature Range High: +155°C; Device Class L2: Resistors; Temperature: -55°C to +155°C; Composition: Thick Film; Footprint Url: http://www.yageo.com/exep/pages/download/literatures/PYu-R_Mount_10.pdf; ComponentLink2URL: http://www.yageo.com/documents/recent/PYu-AC_51_RoHS_L_6.pdf; Device Class L1: Passive Components; Resistance: 120Ω; Height: 0.6mm; ComponentLink2Description: Datasheet; Octopart: https://octopart.com/ac0805jr-07120rl-yageo-52448213; Automotive: Yes; Digikey Description: RES SMD 120 OHM 5% 1/8W 0805; Temperature Range Low: -55°C; Lead Free: Yes; Device Class L3: Chip SMD Resistors; Series: AC; Power Rating: 1/8W; Manufacturer Part Number: AC0805JR-07120RL; Mouser Description: Thick Film Resistors - SMD 1/8W 120ohm 5% AEC-Q200
R8 = CMP-03412-037889-1: Anti-Sulfurated Chip Resistor Automotive Grade 1MΩ 1% 0.125W ±100ppm/°C 0805; Max Power Dissipation: 125mW; Height: 0.024inch; Packaging: Tape and Reel; Tolerance: 1%; Series: AF; Features: Moisture Resistant; Width: 0.049inch; Resistor Type: Thick Film; Number of Terminations: 2; RoHS Compliant: Yes; Max Operating Temperature: 155°C; Case/Package: 0805; Temperature Coefficient: 100ppm/°C; Min Operating Temperature: -55°C; Length: 0.079inch
R9 R13 R31 R46 = CMP-03211-002989-1: CRGCQ 0805 10K 5%; Manufacturer: TE Connectivity; Voltage Rating: 150V; Temperature Coefficient: ±100ppm/°C; Resistance: 10KΩ; Value: 10KΩ; Power Rating: 0.125W; Tolerance: 0.05; Automotive Grade: Grade 914; Height: 0.65mm; Lead Free: Yes; Temperature Range High: +155°C; Composition: Thick Film; Temperature Range Low: -55°C; Ambient Temperature Range High: +70°C; Temperature: -55°C to +155°C; Package: CRGCQ0805; Device Class L2: Resistors; RoHS: TRUE; ComponentLink2URL: https://www.te.com/commerce/DocumentDelivery/DDEController?Action=showdoc&DocId=Data+Sheet%7F1773204-3%7F1%7Fpdf%7FEnglish%7FENG_DS_1773204-3_1.pdf%7F4-2176341-923; Manufacturer Part Number: CRGCQ0805J10K; Series: CRGCQ; Device Class L1: Passive Components; Ipc Land Pattern Name: RESC200125X55; ComponentLink2Description: Datasheet; Category: Res; Digikey Description: CRGCQ 0805 10K 5%; Mouser Description: Res Thick Film 0805 10K Ohm 5% 0.125W(1/8W) ±100ppm/C Pad SMD Automotive T/R; Automotive: Yes; Octopart: https://octopart.com/crgcq0805j10k-te+connectivity-91018201; Device Class L3: Chip SMD Resistors
R10 = CMP-03211-000816-1: CRGCQ 0805 100K 1%; Manufacturer: TE Connectivity; Tolerance: 0.01; Power Rating: 0.125W; Value: 100KΩ; Temperature Coefficient: ±100ppm/°C; Voltage Rating: 150V; RoHS: TRUE; ComponentLink2URL: https://www.te.com/commerce/DocumentDelivery/DDEController?Action=showdoc&DocId=Data+Sheet%7F1773204-3%7F1%7Fpdf%7FEnglish%7FENG_DS_1773204-3_1.pdf%7F4-2176341-1150; Category: Res; Device Class L2: Resistors; Height: 0.65mm; Ambient Temperature Range High: +70°C; Ipc Land Pattern Name: RESC200125X55; Octopart: https://octopart.com/crgcq0805f100k-te+connectivity-91018138; Digikey Description: CRGCQ 0805 100K 1%; Temperature Range High: +155°C; Lead Free: Yes; Automotive: Yes; Temperature Range Low: -55°C; Device Class L1: Passive Components; Device Class L3: Chip SMD Resistors; Mouser Description: Res Thick Film 0805 100K Ohm 1% 0.125W(1/8W) ±100ppm/C Pad SMD Automotive T/R; Temperature: -55°C to +155°C; Composition: Thick Film; ComponentLink2Description: Datasheet; Automotive Grade: Grade 1141; Package: CRGCQ0805; Manufacturer Part Number: CRGCQ0805F100K; Series: CRGCQ
R12 R14 R26-R30 R32 R34 R47 = CMP-26527-001731-1: 100Ω ±1% 0.125W 0805 Thick Film Chip Resistor AEC-Q200 compliant; Power Rating: 250mW; Temperature Coefficient: 100ppm/°C; Resistance: 100R; Max Power Dissipation: 125mW; Radiation Hardening: No; RoHS Compliant: Yes; Case Code (Imperial): 0805; Depth: 1.25mm; Length: 2mm; Min Operating Temperature: -55°C; Series: RMCF; Packaging: Tape and Reel; Features: Automotive AEC-Q200; Height: 0.026inch; Size Code: 0805; Tolerance: 1%; Number of Terminations: 2; Max Operating Temperature: 155°C; Case/Package: 0805; Width: 0.049inch; Contact Plating: Tin; Resistor Type: Thick Film; Construction: Rectangular; Lead Free: Lead Free; Military Standard: Not; Case Code (Metric): 2012; Mount: Surface Mount
R16 = CMP-2001-04488-2: RES SMD 220 OHM 1% 1/8W 0805; Manufacturer: Yageo; Value: 220Ω; Tolerance: 0.01; Voltage Rating: 150V; Automotive Grade: Grade 0; Automotive: Yes; Composition: Thick Film; Lead Free: Yes; Octopart: https://octopart.com/ac0805fr-07220rl-yageo-26041145; Series: AC; Device Class L1: Passive Components; Temperature: -55°C to +155°C; Device Class L3: Chip SMD Resistors; Package: AC0805; Digikey Description: RES SMD 220 OHM 1% 1/8W 0805; ComponentLink2URL: http://www.yageo.com/documents/recent/PYu-AC_51_RoHS_L_6.pdf; ComponentLink2Description: Datasheet; Resistance: 220Ω; Mouser Description: Thick Film Resistors - SMD 1/8W 220ohm 1% AEC-Q200; Ipc Land Pattern Name: RESC200125X50; Power Rating: 1/8W; Device Class L2: Resistors; Category: Res; Footprint Url: http://www.yageo.com/exep/pages/download/literatures/PYu-R_Mount_10.pdf; Manufacturer Part Number: AC0805FR-07220RL; Temperature Range Low: -55°C; Height: 0.6mm; Temperature Range High: +155°C; RoHS: TRUE
R17 R19 = CMP-2001-04488-2: RES SMD 220 OHM 1% 1/8W 0805; Manufacturer: Yageo; Tolerance: 0.01; Voltage Rating: 150V; Automotive Grade: Grade 0; Automotive: Yes; Composition: Thick Film; Lead Free: Yes; Octopart: https://octopart.com/ac0805fr-07220rl-yageo-26041145; Series: AC; Device Class L1: Passive Components; Temperature: -55°C to +155°C; Device Class L3: Chip SMD Resistors; Package: AC0805; Digikey Description: RES SMD 220 OHM 1% 1/8W 0805; ComponentLink2URL: http://www.yageo.com/documents/recent/PYu-AC_51_RoHS_L_6.pdf; ComponentLink2Description: Datasheet; Resistance: 220Ω; Mouser Description: Thick Film Resistors - SMD 1/8W 220ohm 1% AEC-Q200; Ipc Land Pattern Name: RESC200125X50; Power Rating: 1/8W; Device Class L2: Resistors; Category: Res; Footprint Url: http://www.yageo.com/exep/pages/download/literatures/PYu-R_Mount_10.pdf; Manufacturer Part Number: AC0805FR-07220RL; Temperature Range Low: -55°C; Height: 0.6mm; Temperature Range High: +155°C; RoHS: TRUE
R33 R36 R37 = CMP-26527-001731-1: 100Ω ±1% 0.125W 0805 Thick Film Chip Resistor AEC-Q200 compliant; Power Rating: 250mW; Temperature Coefficient: 100ppm/°C; Max Power Dissipation: 125mW; Radiation Hardening: No; RoHS Compliant: Yes; Case Code (Imperial): 0805; Depth: 1.25mm; Length: 2mm; Min Operating Temperature: -55°C; Series: RMCF; Packaging: Tape and Reel; Features: Automotive AEC-Q200; Height: 0.026inch; Size Code: 0805; Tolerance: 1%; Number of Terminations: 2; Max Operating Temperature: 155°C; Case/Package: 0805; Width: 0.049inch; Contact Plating: Tin; Resistor Type: Thick Film; Construction: Rectangular; Lead Free: Lead Free; Military Standard: Not; Case Code (Metric): 2012; Mount: Surface Mount
SW1 = CMP-1453-00002-5: Switch Tactile Spst-no 0.05A 12V; Manufacturer Lifecycle Status: ACTIVE; Throw Configuration: SPST; Current Rating: 50mA; Switch Travel: 250µm; Illumination Type: Illuminated, Non-Illuminated; YEOL: 1 = Estimated lifetime > 10 years; Insulation Resistance: 100MΩ; Switch Function: Off-Mom; Mechanical Life: 200kcycles; Actuator Material: Liquid Crystal Polymer, Polymer; Width: 6.2mm; REACH SVHC: No; Contact Material: Steel; RoHS: Compliant; Contact Plating: Silver; Voltage Rating: 12V; Packaging: Bulk; Mount: Through Hole; Diameter: 3.5mm; Max Operating Temperature: 85°C; Lifecycle Status: Production; Min Operating Temperature: -40°C; Length: 6.2mm; Height: 4.3mm; Contact Current Rating: 50mA; Termination: PC Pin
U1 = CMP-04918-000394-1: IC REG BUCK 3.3V 3A TO263-5; Synchronous Rectifier: No; Output Configuration: Positive; Min Supply Voltage: 4.5V; Operating Supply Voltage: 40V; Output Type: Fixed; Switching Frequency: 173kHz; Quiescent Current: 5mA; Efficiency: 73%; Number of Outputs: 1; Output Voltage: 3.3V; Lead Free: Contains Lead; Max Output Current: 3A; Packaging: Cut Tape; Case/Package: TO-263-5; RoHS Compliant: Yes; Output Current: 3A; Series: LM2596; Min Input Voltage: 4.5V; Min Operating Temperature: -40°C; Number of Pins: 5; REACH SVHC: No SVHC; Min Output Voltage: 3.3V; Radiation Hardening: No; Weight: 0.056128oz; Max Input Voltage: 40V; Nominal Output Voltage: 3.3V; Package Quantity: 500; Mount: Surface Mount; Operating Supply Current: 5mA; Max Operating Temperature: 125°C
U2 = CMP-0069-00282-2: SIMPLE SWITCHER® Power Converter 150 KHz 3A Step-Down Voltage Regulator, 5-pin TO-263; Manufacturer: National Semiconductor; PowerWise: N; PackageTopMarking: NSUZXYTTE#*LM2596S*-5.0 P+; RevisionNote: Component URLs added; ComponentLink3URL: http://www.national.com/packaging/folders/ts5b.html; Code_JEDEC: MO-169-AB; ComponentLink1Description: LM2596 Datasheet; PackageVersion: revD, Apr-2005; DatasheetVersion: May-2002; ComponentLink2Description: LM2596 Web Page; PackageReference: TS5B; PackageDescription: TO-263, Molded, .400 x .390 x .180in, 5 Lead, .067in Pitch, Surface Mount; CompType: Switcher; ComponentLink1URL: http://www.national.com/ds/LM/LM2596.pdf; ComponentLink3Description: TS5B Package Page; PinCount: 5; RoHS: N; ComponentLink2URL: http://www.national.com/pf/LM/LM2596.html
U3 = CMP-0315-00015-3: IC TRANSCEIVER HALF 1/1 8SOIC; Number of Transceivers: 1; Operating Supply Voltage: 3.3V; Number of I/Os: 2; Max Supply Current: 17mA; Max Supply Voltage: 3.6V; Min Supply Voltage: 3V; Data Rate: 1Mbps; Min Operating Temperature: -40°C; Packaging: Tape and Reel; Lead Free: Lead Free; Number of Transmit Buffers: 1; Max Operating Temperature: 85°C; Number of Receive Buffers: 1; Number of Pins: 8; Package Quantity: 1; Radiation Hardening: No; Case/Package: D; REACH SVHC: No SVHC; Weight: 0.002561oz; Termination: SMD/SMT; Contact Plating: Gold; Nominal Supply Current: 17mA; Number of Receivers: 1; Number of Drivers: 1
U4 = CMP-0237-00201-3: ARM Cortex-M3 32-bit MCU, 512 KB Flash, 64 KB Internal RAM, 51 I/Os, 64-pin LQFP, -40 to 85 degC, Tray; FLASH Size (Prog) (kB): 512; Internal RAM Size (kB): 64; A/D Converter: 3x12-bit (16 Channel); I/Os (High Current): 51; Supply Voltage(Vcc) min (V): 2; D/A Converter: 2x12-bit (2 Channel); Operating Frequency(F) (Processor speed) (MHz): 72; PackageDescription: 64-Pin Low Profile Quad Flat Package, 10 x 10 mm Body, 0.5 mm Pitch; ComponentLink3URL: http://www.st.com/st-web-ui/static/active/en/resource/technical/document/datasheet/DM00037051.pdf; DatasheetVersion: Rev. 8; Packing: Tray; PackageReference: LQFP64; ComponentLink3Description: Package Specification; Core: ARM Cortex-M3; Mounting Technology: Surface Mount; PartNumber: STM32F103RET6; PackageVersion: Rev. 4, 06/2013; ComponentLink1URL: http://www.st.com/web/en/home.html; ComponentLink1Description: Manufacturer URL; ComponentLink2Description: Datasheet; ComponentLink2URL: http://www.st.com/st-web-ui/static/active/en/resource/technical/document/datasheet/CD00191185.pdf
U5 = CMP-0188-01008-2: 12-Bit Quad Digital-to-Analog Converter with EEPROM Memory, 10-pin MSOP, Extended Temperature; ComponentLink2URL: http://ww1.microchip.com/downloads/en/DeviceDoc/22187E.pdf; ComponentLink3Description: Package Specification; PackageReference: MSOP-UN10; ComponentLink3URL: http://www.microchip.com/stellent/groups/techpub_sg/documents/packagingspec/en012702.pdf; ComponentLink2Description: Datasheet; PackageDescription: 10-Lead Plastic Micro Small Outline Package (UN) [MSOP]; DatasheetVersion: revE, Oct-2010; RevisionNote: URLs added. DatasheetVersion updated.; PackageVersion: revBB, Aug-2009; ComponentLink1Description: Manufacturer URL; ComponentLink1URL: http://www.microchip.com/
U6 = CMP-2000-04953-1: High-Voltage, High-Current Darlington Transistor Array, 0.5 A, 50 V, -20 to 70 degC, 16-Pin SOIC (D), Green (RoHS & no Sb/Br), Tape and Reel; Manufacturer: TexasInstruments; Peak DC Collector Current: 0.5A; Package Version: 4040047-6/M, 06/2011; Maximum Collector Emitter Voltage: 50V; Configuration: Array7; Maximum Collector Emitter Saturation Voltage: 1.1@100mA; Rad Hard: No; Packaging: Tape&Reel; Datasheet URL: http://www.ti.com/general/docs/lit/getliterature.tsp?genericPartNumber=uln2003a&fileType=pdf; Package Reference: D16; Category: DarlingtonBJT; Datasheet Version: Rev. O, 01/2016; Manufacturer URL: http://www.ti.com/; Type: NPN; Package Description: 16-Pin Plastic Small Outline, Body 9.9 x 3.9 mm, Pitch 1.27 mm; Mounting: SurfaceMount; Package: 16SOIC; Package URL: http://www.ti.com/lit/ml/mpds178g/mpds178g.pdf
U7 U8 = CMP-2000-04956-2: IC TRNSLTR BIDIRECTIONAL 20TSSOP; Number of Inputs: 8; Supply Current: 8uA; Low Level Output Current: 50mA; Min Supply Voltage: 1.2V; Quiescent Current: 3uA; Output Type: Voltage; Propagation Delay: 4.8ns; Max Supply Voltage: 5.5V; Output Current: 620uA; Turn-On Delay Time: 312ns; Logic Function: Translator; Data Rate: 60Mbps; Rise Time: 6.3ns; High Level Output Current: -50mA; Number of Pins: 20; Packaging: Tape and Reel; Max Operating Temperature: 85°C; Height: 1.15mm; Nominal Supply Current: 8uA; Termination: SMD/SMT; Lead Free: Lead Free; Package Quantity: 1; Number of Bits: 8; Weight: 0.002716oz; Contact Plating: Gold; Series: -; Width: 4.4mm; Radiation Hardening: No; Mount: Surface Mount; Length: 6.5mm; Case/Package: TSSOP; REACH SVHC: No SVHC; RoHS Compliant: Yes; Min Operating Temperature: -40°C; Number of Channels: 8
X1 = AS-8.000-18-SP: No Description Available; Manufacturer_Name: Raltron; Type: Crystals; Copyright: Copyright (C) 2026 Ultra Librarian. All rights reserved.; Manufacturer_Part_Number: AS-8.000-18-SP
J17 = 1803442: Package: None; Price: None; Value: *; MP: 1803442; Availability: Unavailable